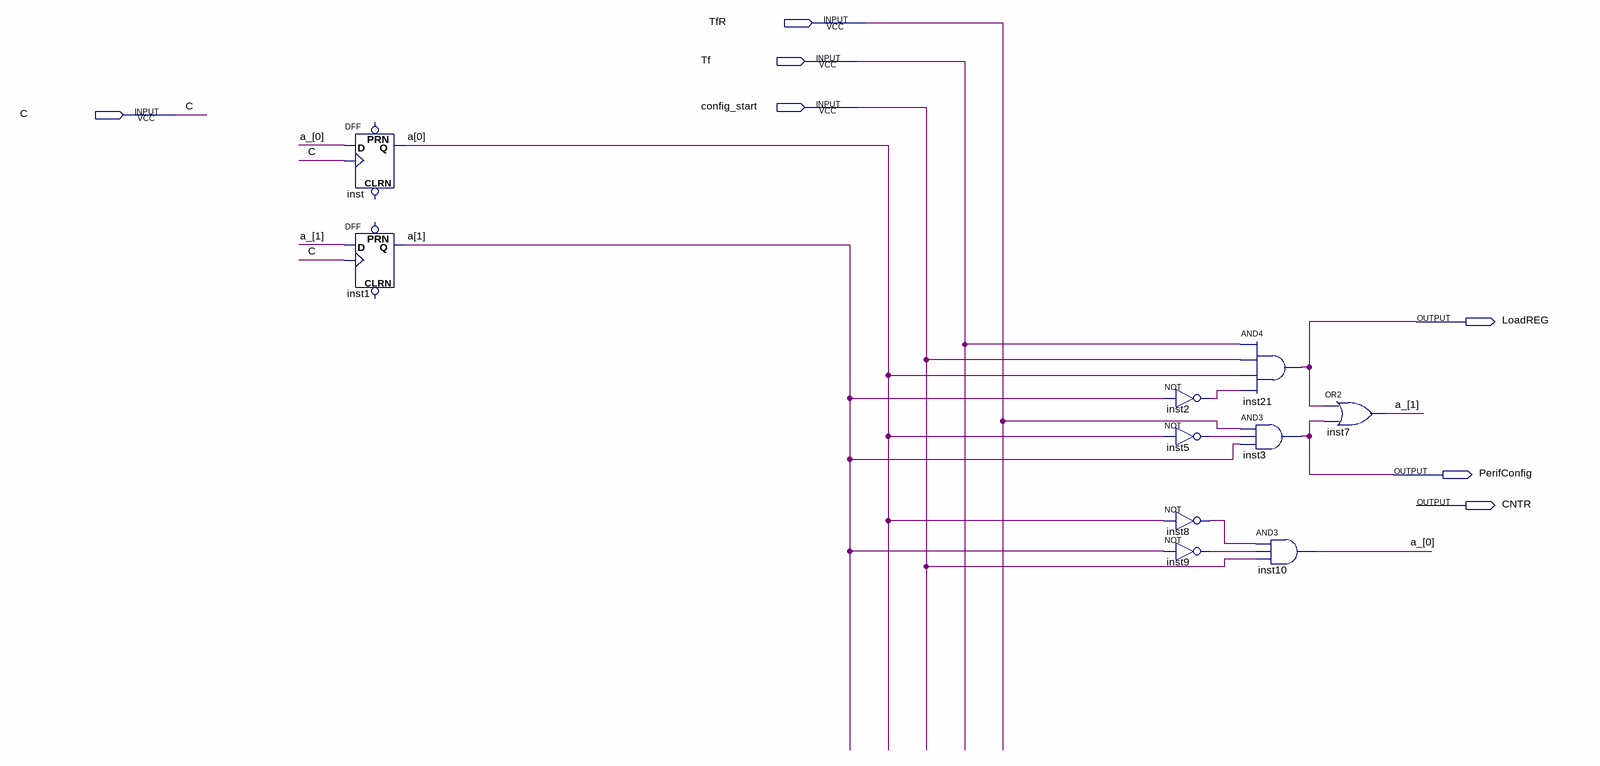
[diagram p0: schematic sheet]
// Quartus schematic ConfigCD.bdf as structural Verilog: 10 symbols, 7 pins
module ConfigCD (
  input  TfR,
  input  Tf,
  input  config_start,
  input  C,
  output LoadREG,
  output PerifConfig,
  output CNTR
);

  wire inst2_out, inst5_out, inst8_out, inst9_out;
  wire [1:0] a, a_;

  DFF inst (.CLK(C), .D(a_[0]), .Q(a[0]));  // open: CLRN, PRN
  DFF inst1 (.CLK(C), .D(a_[1]), .Q(a[1]));  // open: CLRN, PRN
  not inst2 (inst2_out, a[1]);
  not inst5 (inst5_out, a[0]);
  not inst8 (inst8_out, a[0]);
  not inst9 (inst9_out, a[1]);
  and inst21 (LoadREG, Tf, config_start, a[0], inst2_out);
  and inst3 (PerifConfig, TfR, inst5_out, a[1]);
  and inst10 (a_[0], inst8_out, inst9_out, config_start);
  or inst7 (a_[1], LoadREG, PerifConfig);
endmodule
